# Altium schematic sheet Sheet1.SchDoc
size A4; SheetNumber: 1; SheetTotal: 7
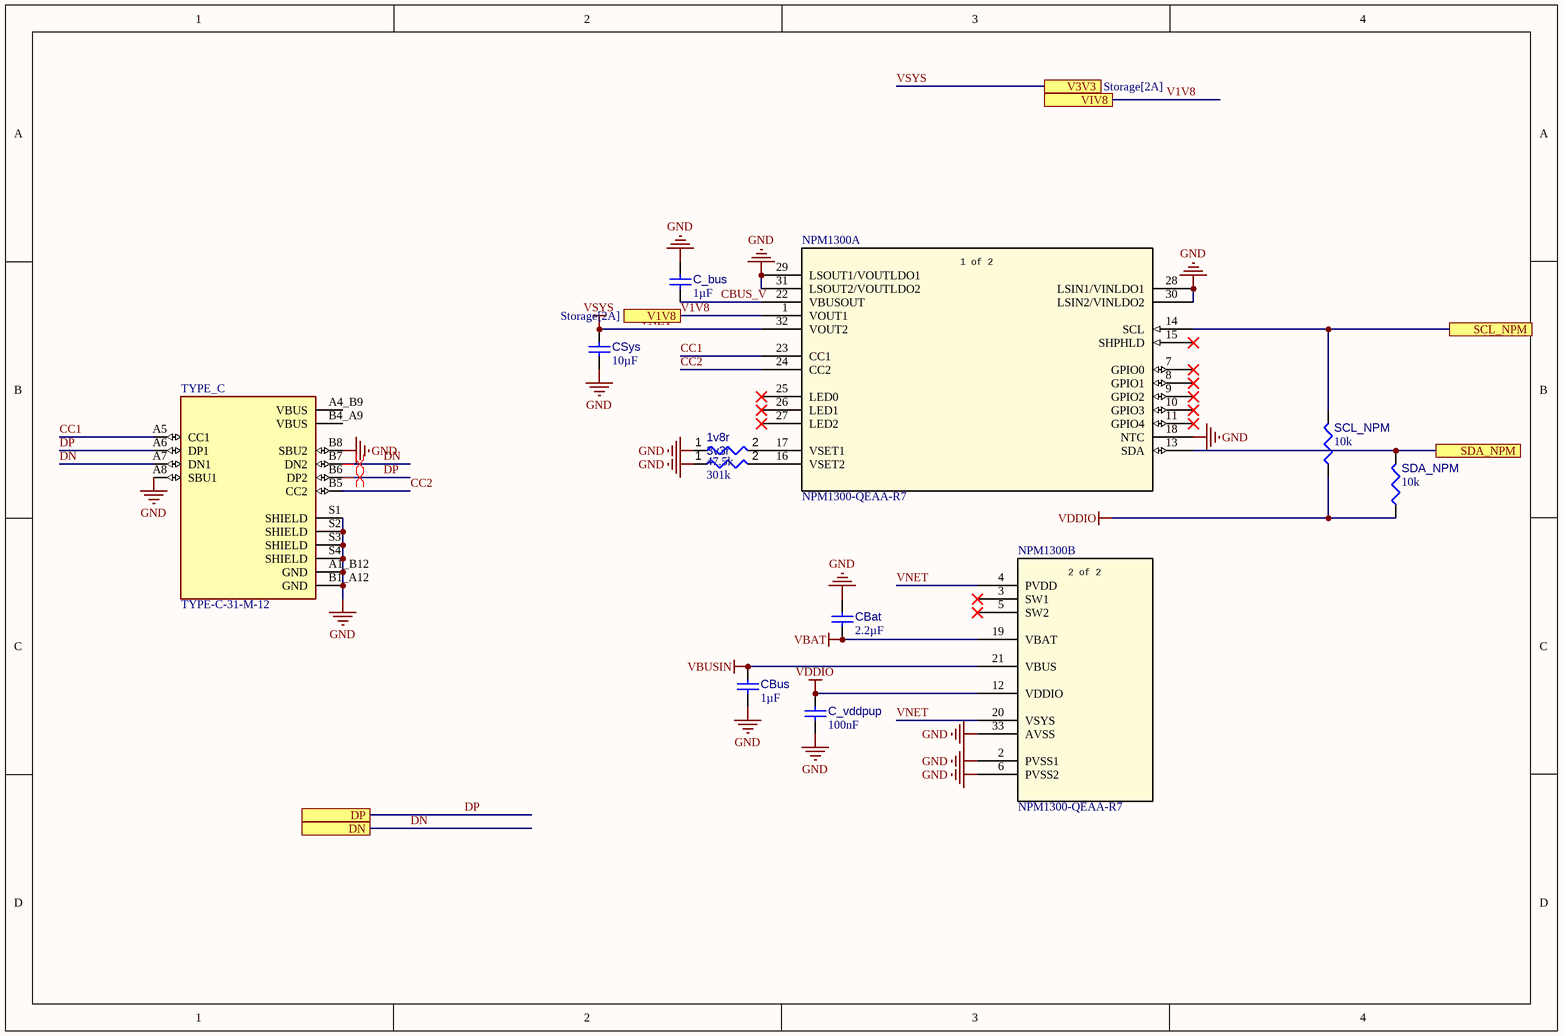
[diagram p0: Sheet1.SchDoc]

## Parts
1v8r  value 47.5k  [RESC0402(1005)_L]  (hidden comment: Resistor 47K5 +/-1 % 0402 63 mW)
3v3r  value 301k  [RESC0402(1005)_L]  (hidden comment: 301KR2F)
C_bus  value 1µF  [CAPC1005X55X25LL05T10]  (hidden comment: Capacitor 1 uF +/- 10% 6.3 V 0402)
C_vddpup  value 100nF  [CAPC1608X90X40NL10T20]  (hidden comment: Capacitor 100 nF +/-10% 50 V 0603)
CBat  value 2.2µF  [CAPC0402(1005)60_L]  (hidden comment: Capacitor 2,2µF +/-20% 10V 0402)
CBus  value 1µF  [CAPC1005X55X25LL05T10]  (hidden comment: Capacitor 1 uF +/- 10% 6.3 V 0402)
CSys  value 10µF  [CAPC0805(2012)145_L]  (hidden comment: Capacitor 10µF +/-20% 25V 0805)
NPM1300  NPM1300-QEAA-R7  [QFN32_5X5_NOR]  (parts A,B of 2)
SCL_NPM  value 10k  [RESC0402(1005)_L]  (hidden comment: 10KR2F)
SDA_NPM  value 10k  [RESC0402(1005)_L]  (hidden comment: 10KR2F)
TYPE_C  TYPE-C-31-M-12  [HRO_TYPE-C-31-M-12]

## Ports
DN, DP, SCL_NPM, SDA_NPM, V1V8 (see Storage[2A]), V3V3 (see Storage[2A]), VIV8

## Nets
GND: 1v8r.1 3v3r.1 C_bus.2 C_vddpup.1 CBat.2 CBus.1 CSys.1 NPM1300.2(PVSS1) NPM1300.6(PVSS2) NPM1300.18(NTC) NPM1300.28(LSIN1/VINLDO1) NPM1300.29(LSOUT1/VOUTLDO1) NPM1300.30(LSIN2/VINLDO2) NPM1300.31(LSOUT2/VOUTLDO2) NPM1300.33(AVSS) TYPE_C.A1_B12(GND) TYPE_C.A8(SBU1) TYPE_C.B1_A12(GND) TYPE_C.B8(SBU2) TYPE_C.S1(SHIELD) TYPE_C.S2(SHIELD) TYPE_C.S3(SHIELD) TYPE_C.S4(SHIELD)
VBAT: CBat.1 NPM1300.19(VBAT)
VBUSIN: CBus.2 NPM1300.21(VBUS)
VDDIO: C_vddpup.2 NPM1300.12(VDDIO) SCL_NPM.1 SDA_NPM.1
VNET: CSys.2 NPM1300.4(PVDD) NPM1300.20(VSYS) NPM1300.32(VOUT2) ; port V3V3  [also labelled VSYS]
CBUS_V: C_bus.1 NPM1300.22(VBUSOUT)
CC1: NPM1300.23(CC1) TYPE_C.A5(CC1)
CC2: NPM1300.24(CC2) TYPE_C.B5(CC2)
DN: TYPE_C.A7(DN1) TYPE_C.B7(DN2) ; port DN
DP: TYPE_C.A6(DP1) TYPE_C.B6(DP2) ; port DP
SCL_NPM: NPM1300.14(SCL) SCL_NPM.2 ; port SCL_NPM
SDA_NPM: NPM1300.13(SDA) SDA_NPM.2 ; port SDA_NPM
V1V8: NPM1300.1(VOUT1) ; port V1V8, port VIV8
Net1v8r_2: 1v8r.2 NPM1300.17(VSET1)
Net3v3r_2: 3v3r.2 NPM1300.16(VSET2)

Not connected (* = marked no-connect by the designer): NPM1300 3(SW1)* 5(SW2)* 7(GPIO0)* 8(GPIO1)* 9(GPIO2)* 10(GPIO3)* 11(GPIO4)* 15(SHPHLD)* 25(LED0)* 26(LED1)* 27(LED2)*; TYPE_C A4_B9(VBUS) B4_A9(VBUS)

## Layout directives
differential pair: DN, DP

## Notes on the sheet
- (in symbol CMP-052-000000-1, part A) 1 of 2
- (in symbol CMP-052-000000-1, part B) 2 of 2

## Library data of the parts
1v8r = CMP-009-00137-3: Chip Resistor, 47,5 kOhms, +/-1 %, 63 mW, -55 to 155 degC, 0402; Power: 63mW; Tolerance: 1%; Pins: 2; Case/Package: 0402; Min Operating Temperature: -55°C; Max Operating Temperature: 155°C
3v3r = CMP-009-00092-2: 301K 0.063W 1% 0402 (1005 Metric)  SMD; Power: 63mW; Tolerance: 1%; Mounting Technology: SMT; Case/Package: 0402; Pins: 2
C_bus CBus = CMP-001-00008-6: Chip Capacitor, 1 uF, +/- 10%, 6.3 V, 0402 (1005 Metric); Capacitor Type: Ceramic; Voltage Rating: 6.3V; Max Operating Temperature: 85°C; Mounting Technology: SM; Tolerance: 10%; Case/Package: 0402; RoHS Compliant: True; Min Operating Temperature: -55°C; Pins: 2
C_vddpup = CMP-001-00017-6: Chip Capacitor, 100 nF, +/- 10%, 50 V, 0603 (1608 Metric); Voltage Rating: 50V; Capacitor Type: Ceramic; Tolerance: 10%; Mounting Technology: SM; Max Operating Temperature: 125°C; RoHS Compliant: True; Pins: 2; Case/Package: 0603; Min Operating Temperature: -55°C
CBat = CMP-001-00056-4: Chip Capacitor, 2,2µF +/-20%, 10V, 0402, Thickness 0.6 mm; Tolerance: 10%; Mounting Technology: SMT; Max Operating Temperature: 85°C; Case/Package: 0402; Pins: 2; Min Operating Temperature: -55°C; Voltage Rating: 10V
CSys = CMP-001-00079-4: Chip Capacitor, 10µF +/-20%, 25V, 0805, Thickness 1.45 mm; Tolerance: 10%; Max Operating Temperature: 85°C; Case/Package: 0805; Voltage Rating: 25V; Min Operating Temperature: -55°C; Mounting Technology: SMT; Pins: 2
NPM1300 = CMP-052-000000-1: Description; Manufacturer_Name: Nordic Semiconductor; Type: Type; Copyright: Copyright (C) 2026 Ultra Librarian. All rights reserved.; Source: NPM1300-QEAA-R7.SchLib; RefDes: RefDes; Manufacturer_Part_Number: NPM1300-QEAA-R7; Design Item ID: NPM1300-QEAA-R7
SCL_NPM SDA_NPM = CMP-009-00066-2: 10K 0.063W 1% 0402 (1005 Metric)  SMD; Power: 63mW; Case/Package: 0402; Mounting Technology: SMT; Pins: 2; Tolerance: 1%
TYPE_C = CMP-027-000000-1: USB Connectors 24 Receptacle 1 8.94*7.3mm RoHS; MF: HRO Electronics Co., Ltd.; Check_prices: https://www.snapeda.com/parts/TYPE-C-31-M-12/HRO+Electronics+Co.%252C+Ltd./view-part/?ref=eda; SnapEDA_Link: https://www.snapeda.com/parts/TYPE-C-31-M-12/HRO+Electronics+Co.%252C+Ltd./view-part/?ref=snap; Source: TYPE-C-31-M-12.SchLib; Value: *; MP: TYPE-C-31-M-12; Component Type: Standard; Design Item ID: TYPE-C-31-M-12; Pin Count: 16; Package: Package